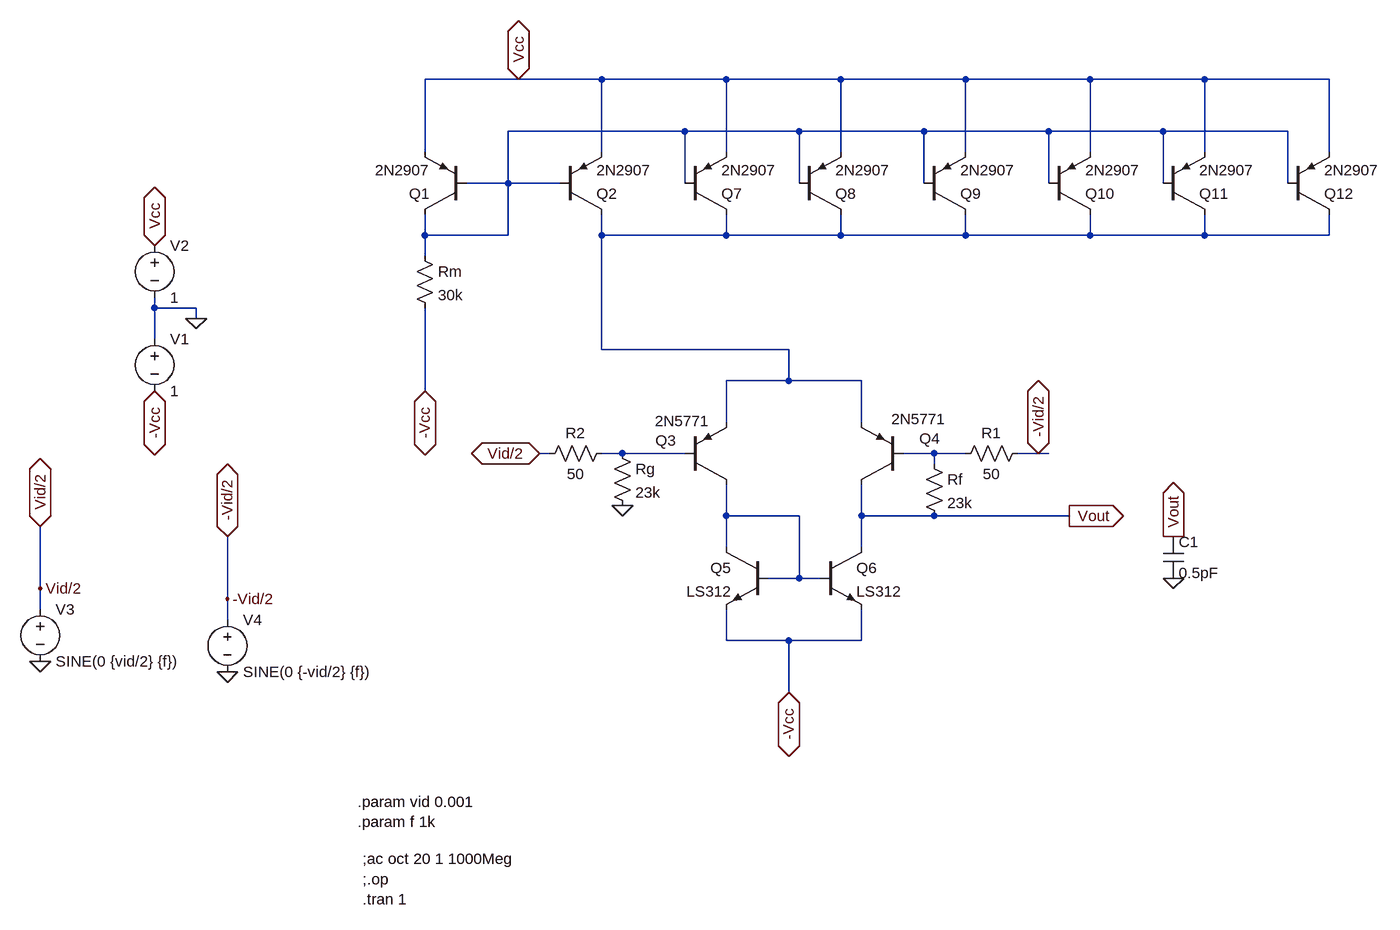
[diagram p0: schematic diff_amp_biased_by_current_mirroir_with_RC_SON.asc]
diff_amp_biased_by_current_mirroir_with_RC_SON.asc, the LTspice schematic file:
Version 4
SHEET 1 2336 816
WIRE 784 -480 640 -480
WIRE 912 -480 784 -480
WIRE 1104 -480 912 -480
WIRE 1280 -480 1104 -480
WIRE 1472 -480 1280 -480
WIRE 1664 -480 1472 -480
WIRE 1840 -480 1664 -480
WIRE 2032 -480 1840 -480
WIRE 1040 -400 768 -400
WIRE 1216 -400 1040 -400
WIRE 1408 -400 1216 -400
WIRE 1600 -400 1408 -400
WIRE 1776 -400 1600 -400
WIRE 1968 -400 1776 -400
WIRE 640 -368 640 -480
WIRE 912 -368 912 -480
WIRE 1104 -368 1104 -480
WIRE 1280 -368 1280 -480
WIRE 1472 -368 1472 -480
WIRE 1664 -368 1664 -480
WIRE 1840 -368 1840 -480
WIRE 2032 -368 2032 -480
WIRE 768 -320 768 -400
WIRE 768 -320 704 -320
WIRE 848 -320 768 -320
WIRE 1040 -320 1040 -400
WIRE 1216 -320 1216 -400
WIRE 1408 -320 1408 -400
WIRE 1600 -320 1600 -400
WIRE 1776 -320 1776 -400
WIRE 1968 -320 1968 -400
WIRE 640 -240 640 -272
WIRE 768 -240 768 -320
WIRE 768 -240 640 -240
WIRE 912 -240 912 -272
WIRE 1104 -240 1104 -272
WIRE 1104 -240 912 -240
WIRE 1280 -240 1280 -272
WIRE 1280 -240 1104 -240
WIRE 1472 -240 1472 -272
WIRE 1472 -240 1280 -240
WIRE 1664 -240 1664 -272
WIRE 1664 -240 1472 -240
WIRE 1840 -240 1840 -272
WIRE 1840 -240 1664 -240
WIRE 2032 -240 2032 -272
WIRE 2032 -240 1840 -240
WIRE 640 -208 640 -240
WIRE 224 -128 224 -144
WIRE 288 -128 224 -128
WIRE 288 -112 288 -128
WIRE 224 -80 224 -128
WIRE 912 -64 912 -240
WIRE 1200 -64 912 -64
WIRE 1200 -16 1200 -64
WIRE 1200 -16 1104 -16
WIRE 1312 -16 1200 -16
WIRE 640 0 640 -128
WIRE 1104 48 1104 -16
WIRE 1312 48 1312 -16
WIRE 832 96 816 96
WIRE 944 96 912 96
WIRE 1040 96 944 96
WIRE 1424 96 1376 96
WIRE 1472 96 1424 96
WIRE 1584 96 1552 96
WIRE 1600 96 1584 96
WIRE 1424 112 1424 96
WIRE 1104 192 1104 144
WIRE 1216 192 1104 192
WIRE 1312 192 1312 144
WIRE 1424 192 1312 192
WIRE 1632 192 1424 192
WIRE 1104 240 1104 192
WIRE 1312 240 1312 192
WIRE 1216 288 1216 192
WIRE 1216 288 1168 288
WIRE 1248 288 1216 288
WIRE 48 304 48 208
WIRE 336 320 336 224
WIRE 48 336 48 304
WIRE 336 352 336 320
WIRE 1104 384 1104 336
WIRE 1200 384 1104 384
WIRE 1312 384 1312 336
WIRE 1312 384 1200 384
WIRE 1200 464 1200 384
FLAG 288 -112 0
FLAG 224 0 -Vcc
IOPIN 224 0 BiDir
FLAG 224 -224 Vcc
IOPIN 224 -224 BiDir
FLAG 48 416 0
FLAG 48 304 Vid/2
FLAG 1632 192 Vout
IOPIN 1632 192 Out
FLAG 336 432 0
FLAG 336 320 -Vid/2
FLAG 48 208 Vid/2
IOPIN 48 208 BiDir
FLAG 336 224 -Vid/2
IOPIN 336 224 BiDir
FLAG 816 96 Vid/2
IOPIN 816 96 BiDir
FLAG 1584 96 -Vid/2
IOPIN 1584 96 BiDir
FLAG 1792 224 Vout
IOPIN 1792 224 Out
FLAG 1792 288 0
FLAG 784 -480 Vcc
IOPIN 784 -480 BiDir
FLAG 640 0 -Vcc
IOPIN 640 0 BiDir
FLAG 1200 464 -Vcc
IOPIN 1200 464 BiDir
FLAG 944 176 0
SYMBOL Voltage 224 -96 R0
SYMATTR InstName V1
SYMATTR Value 1
SYMBOL Voltage 224 -240 R0
SYMATTR InstName V2
SYMATTR Value 1
SYMBOL Voltage 48 320 R0
SYMATTR InstName V3
SYMATTR Value SINE(0 {vid/2} {f})
SYMATTR Value2 AC {vid/2}
SYMBOL npn 1168 240 M0
SYMATTR InstName Q5
SYMATTR Value LS312
SYMBOL npn 1248 240 R0
SYMATTR InstName Q6
SYMATTR Value LS312
SYMBOL pnp 1040 144 M180
WINDOW 0 -45 68 Left 2
WINDOW 3 -46 98 Left 2
SYMATTR InstName Q3
SYMATTR Value 2N5771
SYMBOL pnp 1376 144 R180
WINDOW 0 -57 71 Left 2
WINDOW 3 -67 101 Left 2
SYMATTR InstName Q4
SYMATTR Value 2N5771
SYMBOL Voltage 336 336 R0
SYMATTR InstName V4
SYMATTR Value SINE(0 {-vid/2} {f})
SYMATTR Value2 AC {-vid/2}
SYMBOL Cap 1776 224 R0
SYMATTR InstName C1
SYMATTR Value 0.5pF
SYMBOL pnp 704 -272 R180
SYMATTR InstName Q1
SYMATTR Value 2N2907
SYMBOL pnp 848 -272 M180
SYMATTR InstName Q2
SYMATTR Value 2N2907
SYMBOL Res 624 -224 R0
SYMATTR InstName Rm
SYMATTR Value 30k
SYMBOL Res 1408 96 R0
SYMATTR InstName Rf
SYMATTR Value 23k
SYMBOL Res 1568 80 R90
WINDOW 0 0 56 VBottom 2
WINDOW 3 32 56 VTop 2
SYMATTR InstName R1
SYMATTR Value 50
SYMBOL Res 928 80 R0
SYMATTR InstName Rg
SYMATTR Value 23k
SYMBOL Res 928 80 R90
WINDOW 0 0 56 VBottom 2
WINDOW 3 32 56 VTop 2
SYMATTR InstName R2
SYMATTR Value 50
SYMBOL pnp 1040 -272 M180
SYMATTR InstName Q7
SYMATTR Value 2N2907
SYMBOL pnp 1216 -272 M180
SYMATTR InstName Q8
SYMATTR Value 2N2907
SYMBOL pnp 1408 -272 M180
SYMATTR InstName Q9
SYMATTR Value 2N2907
SYMBOL pnp 1600 -272 M180
SYMATTR InstName Q10
SYMATTR Value 2N2907
SYMBOL pnp 1776 -272 M180
SYMATTR InstName Q11
SYMATTR Value 2N2907
SYMBOL pnp 1968 -272 M180
SYMATTR InstName Q12
SYMATTR Value 2N2907
TEXT 536 632 Left 2 !.param vid 0.001\n.param f 1k
TEXT 544 720 Left 2 !;ac oct 20 1 1000Meg\n;.op\n.tran 1

The netlist it stands for:
* diff_amp_biased_by_current_mirroir_with_RC_SON.asc
V1 0 -Vcc 1
V2 Vcc 0 1
V3 Vid/2 0 SINE(0 {vid/2} {f}) AC {vid/2}
Q5 N005 N005 -Vcc 0 LS312
Q6 Vout N005 -Vcc 0 LS312
Q3 N005 N003 N002 0 2N5771
Q4 Vout N004 N002 0 2N5771
V4 -Vid/2 0 SINE(0 {-vid/2} {f}) AC {-vid/2}
C1 Vout 0 0.5pF
Q1 N001 N001 Vcc 0 2N2907
Q2 N002 N001 Vcc 0 2N2907
Rm N001 -Vcc 30k
Rf N004 Vout 23k
R1 -Vid/2 N004 50
Rg N003 0 23k
R2 N003 Vid/2 50
Q7 N002 N001 Vcc 0 2N2907
Q8 N002 N001 Vcc 0 2N2907
Q9 N002 N001 Vcc 0 2N2907
Q10 N002 N001 Vcc 0 2N2907
Q11 N002 N001 Vcc 0 2N2907
Q12 N002 N001 Vcc 0 2N2907
.model NPN NPN
.model PNP PNP
.lib standard.bjt
.param vid 0.001
.param f 1k
;ac oct 20 1 1000Meg
;.op
.tran 1
.backanno
.end